# Altium project ArmBand-Control-Board.PrjPcb (part 2 of 3)

## Sheet Controller-Section.SchDoc
size A4; SheetNumber: 5; SheetTotal: 8
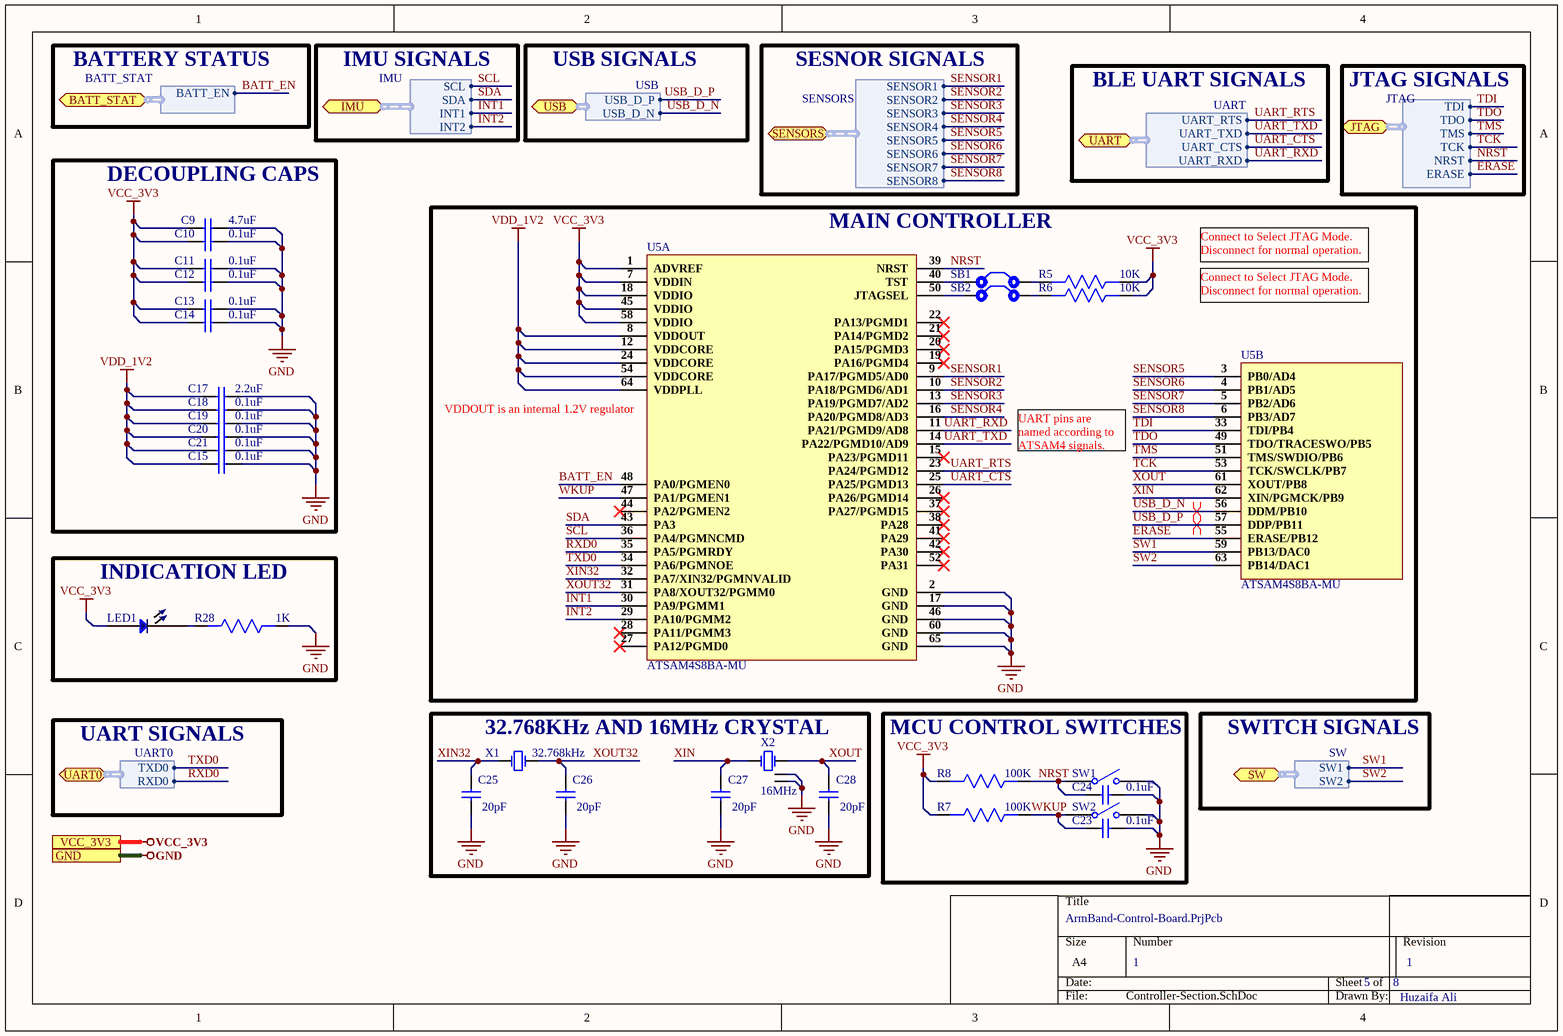
[diagram p4: Controller-Section.SchDoc]

### Parts
C9  4.7uF  [Cap 0402]
C10  0.1uF  [Cap 0402]
C11  0.1uF  [Cap 0402]
C12  0.1uF  [Cap 0402]
C13  0.1uF  [Cap 0402]
C14  0.1uF  [Cap 0402]
C15  0.1uF  [Cap 0402]
C17  2.2uF  [Cap 0402]
C18  0.1uF  [Cap 0402]
C19  0.1uF  [Cap 0402]
C20  0.1uF  [Cap 0402]
C21  0.1uF  [Cap 0402]
C23  0.1uF  [Cap 0402]
C24  0.1uF  [Cap 0402]
C25  20pF  [Cap 0402]
C26  20pF  [Cap 0402]
C27  20pF  [Cap 0402]
C28  20pF  [Cap 0402]
LED1  XZVG68W-2  [LED 0402]  (value not drawn)
R5  10K  [Res0402]
R6  10K  [Res0402]
R7  100K  [Res0402]
R8  100K  [Res0402]
R28  1K  [Res0402]
SB1  Solder Bridge  [Solder Bridge]  (value not drawn)
SB2  Solder Bridge  [Solder Bridge]  (value not drawn)
SW1  TS-1185EC-C-D-B  [TS-1185EC-C-D-B]  (value not drawn)
SW2  TS-1185EC-C-D-B  [TS-1185EC-C-D-B]  (value not drawn)
U5  ATSAM4S8BA-MU  [QFN64]  (parts A,B of 2)
X1  32.768kHz  [X321532768KGD2SI]
X2  16MHz  [X322516MOB4SI]

### Blocks framed on the sheet
DECOUPLING CAPS: C9-C15 C17-C21
MAIN CONTROLLER: R5 R6 SB1 SB2 U5
INDICATION LED: LED1 R28
32.768KHz AND 16MHz CRYSTAL: C25-C28 X1 X2
MCU CONTROL SWITCHES: C23 C24 R7 R8 SW1 SW2

### Ports
BATT_STAT (bidir, harness BATT_STAT), GND, IMU (bidir, harness IMU), JTAG (bidir, harness JTAG), SENSORS (bidir, harness SENSORS), SW (bidir, harness SW), UART0 (bidir, harness UART0), UART (bidir, harness UART), USB (bidir, harness USB), VCC_3V3

### Harnesses
IMU: SCL, SDA, INT1, INT2
JTAG: TDI, TDO, TMS, TCK, NRST, ERASE
UART: UART_RTS, UART_TXD, UART_CTS, UART_RXD
SENSORS: SENSOR1, SENSOR2, SENSOR3, SENSOR4, SENSOR5, SENSOR6, SENSOR7, SENSOR8
BATT_STAT: BATT_EN
SW: SW1, SW2
UART0: TXD0, RXD0
USB: USB_D_P, USB_D_N

### Nets
GND: C9.2 C10.2 C11.2 C12.2 C13.2 C14.2 C15.2 C17.2 C18.2 C19.2 C20.2 C21.2 C23.2 C24.2 C25.1 C26.1 C27.1 C28.1 R28.1 SW1.2 SW2.2 U5.2(GND) U5.17(GND) U5.46(GND) U5.60(GND) U5.65(GND) X2.2(GND) X2.4(GND) ; port GND
VCC_3V3: C9.1 C10.1 C11.1 C12.1 C13.1 C14.1 LED1.1 R5.1 R6.1 R7.2 R8.2 U5.1(ADVREF) U5.7(VDDIN) U5.18(VDDIO) U5.45(VDDIO) U5.58(VDDIO) ; port VCC_3V3
VDD_1V2: C15.1 C17.1 C18.1 C19.1 C20.1 C21.1 U5.8(VDDOUT) U5.12(VDDCORE) U5.24(VDDCORE) U5.54(VDDCORE) U5.64(VDDPLL)
BATT_EN: U5.48(PA0/PGMEN0) ; port BATT_STAT.BATT_EN
ERASE: U5.55(ERASE/PB12) ; port JTAG.ERASE
INT1: U5.30(PA9/PGMM1) ; port IMU.INT1
INT2: U5.29(PA10/PGMM2) ; port IMU.INT2
NRST: C24.1 R8.1 SW1.1 U5.39(NRST) ; port JTAG.NRST
RXD0: U5.35(PA5/PGMRDY) ; port UART0.RXD0
SCL: U5.36(PA4/PGMNCMD) ; port IMU.SCL
SDA: U5.43(PA3) ; port IMU.SDA
SENSOR1: U5.9(PA17/PGMD5/AD0) ; port SENSORS.SENSOR1
SENSOR2: U5.10(PA18/PGMD6/AD1) ; port SENSORS.SENSOR2
SENSOR3: U5.13(PA19/PGMD7/AD2) ; port SENSORS.SENSOR3
SENSOR4: U5.16(PA20/PGMD8/AD3) ; port SENSORS.SENSOR4
SENSOR5: U5.3(PB0/AD4) ; port SENSORS.SENSOR5
SENSOR6: U5.4(PB1/AD5) ; port SENSORS.SENSOR6
SENSOR7: U5.5(PB2/AD6) ; port SENSORS.SENSOR7
SENSOR8: U5.6(PB3/AD7) ; port SENSORS.SENSOR8
SW1: U5.59(PB13/DAC0) ; port SW.SW1
SW2: U5.63(PB14/DAC1) ; port SW.SW2
TCK: U5.53(TCK/SWCLK/PB7) ; port JTAG.TCK
TDI: U5.33(TDI/PB4) ; port JTAG.TDI
TDO: U5.49(TDO/TRACESWO/PB5) ; port JTAG.TDO
TMS: U5.51(TMS/SWDIO/PB6) ; port JTAG.TMS
TXD0: U5.34(PA6/PGMNOE) ; port UART0.TXD0
UART_CTS: U5.25(PA25/PGMD13) ; port UART.UART_CTS
UART_RTS: U5.23(PA24/PGMD12) ; port UART.UART_RTS
UART_RXD: U5.11(PA21/PGMD9/AD8) ; port UART.UART_RXD
UART_TXD: U5.14(PA22/PGMD10/AD9) ; port UART.UART_TXD
USB_D_N: U5.56(DDM/PB10) ; port USB.USB_D_N
USB_D_P: U5.57(DDP/PB11) ; port USB.USB_D_P
WKUP: C23.1 R7.1 SW2.1 U5.47(PA1/PGMEN1)
XIN: C27.2 U5.62(XIN/PGMCK/PB9) X2.1(OSC1)
XIN32: C25.2 U5.32(PA7/XIN32/PGMNVALID) X1.1(OSC1)
XOUT: C28.2 U5.61(XOUT/PB8) X2.3(OSC2)
XOUT32: C26.2 U5.31(PA8/XOUT32/PGMM0) X1.2(OSC2)
NetLED1_2: LED1.2 R28.2
NetR5_2: R5.2 SB1.2
NetR6_2: R6.2 SB2.2
NetSB1_1: SB1.1 U5.40(TST)
NetSB2_1: SB2.1 U5.50(JTAGSEL)

Not connected (* = marked no-connect by the designer): U5 15(PA23/PGMD11)* 19(PA16/PGMD4)* 20(PA15/PGMD3)* 21(PA14/PGMD2)* 22(PA13/PGMD1)* 26(PA26/PGMD14)* 27(PA12/PGMD0)* 28(PA11/PGMM3)* 37(PA27/PGMD15)* 38(PA28)* 41(PA29)* 42(PA30)* 44(PA2/PGMEN2)* 52(PA31)*

### Layout directives
differential pair; net class USB; differential pair class USB_Lines; rule Impedance Constraint [Min = 85.00    Max = 90.00    ]; rule Matched Net Lengths [Tolerance = 50mil]: USB_D_N, USB_D_P

### Notes on the sheet
- BATTERY STATUS
- IMU SIGNALS
- USB SIGNALS
- SESNOR SIGNALS
- BLE UART SIGNALS
- JTAG SIGNALS
- Connect to Select JTAG Mode. Disconnect for normal operation.
- (near U5) VDDOUT is an internal 1.2V regulator
- UART pins are named according to ATSAM4 signals.
- UART SIGNALS
- SWITCH SIGNALS
- 1
- Huzaifa Ali

### Library data of the parts
C9 = EDK105BBJ475MVLF: 16V 4.7uF ±20% 0402 Multilayer Ceramic Capacitors MLCC; Manufacturer: Taiyo Yuden; Manufacturer Part Number: EDK105BBJ475MVLF; Footprint: 0402; Value: 4.7uF
C10-C15 C18-C21 C23 C24 = GRM155R71H104ME14D: CAP CER 0.1UF 50V X7R 0402; Manufacturer: Murata; Tolerance: 20%; Capacitance: 100nF; Supplier 1: Digi-Key; Manufacturer Part Number: GRM155R71H104ME14D; Stock 1: 439844; Pricing 1: 1=0.1, 10=0.038, 100=0.0168, 500=0.01198, 1000=0.00941, 2500=0.00855, 5000=0.00787 (USD); Mount: Surface Mount; Case/Package: 0402; Min Operating Temperature: -55°C; Max Operating Temperature: 125°C; Packaging: Cut Tape; Voltage Rating: 50V; Length: 0.039inch; Width: 0.02inch; Thickness: 0.022inch; ComponentLink1URL: http://search.murata.co.jp/Ceramy/image/img/A01X/G101/ENG/GRM155R71H104ME14-01.pdf?src-supplier=Digi-Key; ComponentLink1Description: http://search.murata.co.jp/Ceramy/image/img/A01X/G101/ENG/GRM155R71H104ME14-01.pdf?src-supplier=Digi-Key; ComponentLink2URL: http://psearch.en.murata.com/capacitor/product/GRM155R71H104ME14%23.pdf?src-supplier=Avnet; ComponentLink2Description: http://psearch.en.murata.com/capacitor/product/GRM155R71H104ME14%23.pdf?src-supplier=Avnet; ComponentLink3URL: http://components.arrow.com/part/dataview/0323_07177683?src-supplier=Arrow+Europe; ComponentLink3Description: http://components.arrow.com/part/dataview/0323_07177683?src-supplier=Arrow+Europe; ComponentLink4URL: http://www.mouser.com/ds/2/281/c02e-2905.pdf?src-supplier=Mouser; ComponentLink4Description: http://www.mouser.com/ds/2/281/c02e-2905.pdf?src-supplier=Mouser; Supplier Part Number 1: 490-10701-1-ND
C17 = GRM155R61E225KE11D: CAP CER 2.2UF 25V X5R 0402; Manufacturer: Murata; Manufacturer Part Number: GRM155R61E225KE11D; Footprint: 0402; Value: 2.2uF
C25-C28 = CC0402JRNPO9BN200: CAP CER 20PF 50V C0G/NPO 0402; Manufacturer: Yageo; Tolerance: 5%; Dielectric: C0G; Supplier 1: Digi-Key; Manufacturer Part Number: CC0402JRNPO9BN200; Stock 1: 453493; Pricing 1: 1=0.1, 10=0.036, 100=0.0162, 500=0.01156, 1000=0.00908, 2500=0.00825, 5000=0.00759 (USD); Mount: Surface Mount; Case/Package: 0402; Number of Pins: 2; Weight: 2.3E-05oz; Case Code (Metric): 1005; Case Code (Imperial): 0402; Min Operating Temperature: -55°C; Max Operating Temperature: 125°C; Capacitance: 20pF; Voltage Rating: 50V; Packaging: Tape and Reel; Package Quantity: 1; Voltage Rating (DC): 50V; Termination: SMD/SMT; Composition: Ceramic; Length: 1mm; Width: 0.02inch; Thickness: 0.022inch; Depth: 0.5mm; REACH SVHC: No SVHC; Lead Free: Lead Free; ComponentLink1URL: http://www.yageo.com/documents/recent/UPY-GP_NP0_16V-to-50V_16.pdf?src-supplier=Digi-Key; ComponentLink1Description: http://www.yageo.com/documents/recent/UPY-GP_NP0_16V-to-50V_16.pdf?src-supplier=Digi-Key; ComponentLink2URL: http://www.yageo.com/documents/recent/UPY-GP_NP0_16V-to-50V_16.pdf?src-supplier=Mouser; ComponentLink2Description: http://www.yageo.com/documents/recent/UPY-GP_NP0_16V-to-50V_16.pdf?src-supplier=Mouser; Supplier Part Number 1: 311-1417-1-ND
LED1 = XZVG68W-2: LED GREEN CLEAR CHIP SMD; Manufacturer: SunLED; Lens Color: Colorless; Luminous Intensity: 49mcd; Test Current: 20mA; Viewing Angle: 120°; Dominant Wavelength: 570nm; Forward Voltage: 2.1V; Supplier 1: Digi-Key; Manufacturer Part Number: XZVG68W-2; Stock 1: 4185; Pricing 1: 1=0.5, 10=0.36, 100=0.16, 500=0.112, 1000=0.092 (USD); Mount: Surface Mount; Case/Package: 0402; Color: Green; Case Code (Metric): 1005; Case Code (Imperial): 0402; Packaging: Tape and Reel; Lens Transparency: Clear; Length: 1mm; Height: 0.6mm; Width: 0.5mm; ComponentLink1URL: http://www.sunledusa.com/products/spec/XZVG68W-2.pdf?src-supplier=Digi-Key; ComponentLink1Description: http://www.sunledusa.com/products/spec/XZVG68W-2.pdf?src-supplier=Digi-Key; ComponentLink2URL: https://www.sunledusa.com/products/spec/XZVG68W-2.pdf?src-supplier=Digi-Key; ComponentLink2Description: https://www.sunledusa.com/products/spec/XZVG68W-2.pdf?src-supplier=Digi-Key; Supplier Part Number 1: 1497-1219-6-ND
R5 R6 = RC0402FR-0710KL: RES SMD 10K OHM 1% 1/16W 0402; Manufacturer: Yageo; Resistance: 10kR; Temperature Coefficient: 100ppm/°C; Voltage Rating (DC): 50V; Power Rating: 62.5mW; Supplier 1: Digi-Key; Manufacturer Part Number: RC0402FR-0710KL; Stock 1: 60122563; Pricing 1: 1=0.1, 10=0.016, 100=0.0064, 1000=0.00289, 2500=0.00251, 5000=0.00207 (USD); Case/Package: 0402; Number of Pins: 2; Case Code (Imperial): 0402; Case Code (Metric): 1005; Min Operating Temperature: -55°C; Max Operating Temperature: 155°C; Composition: Thick Film; Tolerance: 1%; Packaging: Tape and Reel; Voltage Rating: 50V; Termination: SMD/SMT; Military Standard: Not; Working Voltage: 50V; Number of Terminations: 2; Length: 1mm; Height: 0.32mm; Width: 0.5mm; Depth: 0.5mm; Lead Pitch: 0.2mm; REACH SVHC: No SVHC; Lead Free: Lead Free; ComponentLink1URL: http://www.farnell.com/datasheets/2167052.pdf?src-supplier=Element14; ComponentLink1Description: http://www.farnell.com/datasheets/2167052.pdf?src-supplier=Element14; ComponentLink2URL: http://www.farnell.com/datasheets/1686128.pdf?src-supplier=Element14; ComponentLink2Description: http://www.farnell.com/datasheets/1686128.pdf?src-supplier=Element14; ComponentLink3URL: http://www.farnell.com/datasheets/1784430.pdf?src-supplier=Element14; ComponentLink3Description: http://www.farnell.com/datasheets/1784430.pdf?src-supplier=Element14; ComponentLink4URL: http://www.yageo.com/documents/recent/PYu-RC_Group_51_RoHS_L_9.pdf?src-supplier=Mouser; ComponentLink4Description: http://www.yageo.com/documents/recent/PYu-RC_Group_51_RoHS_L_9.pdf?src-supplier=Mouser; Supplier Part Number 1: 311-10.0KLRDKR-ND
R7 R8 = ERJPA2F1003X: RES SMD 100K OHM 1% 1/5W 0402; Manufacturer: Panasonic; Manufacturer Part Number: ERJ-PA2F1003X; Resistance: 100kR; Power Rating: 200mW; Voltage Rating: 50V; Temperature Coefficient: 100ppm/°C; Supplier 1: Digi-Key; Stock 1: 8829; Pricing 1: 1=0.21, 10=0.175, 100=0.0686, 1000=0.02871, 2500=0.02632, 5000=0.02393 (USD); Case/Package: 0402; Case Code (Metric): 1005; Case Code (Imperial): 0402; Min Operating Temperature: -55°C; Max Operating Temperature: 155°C; Packaging: Cut Tape; Composition: Thick Film; Number of Terminations: 2; Tolerance: 1%; Max Power Dissipation: 200mW; Voltage Rating (DC): 50V; Features: Automotive AEC-Q200; Length: 0.039inch; Height: 0.016inch; Width: 0.02inch; REACH SVHC: Unknown; ComponentLink1URL: http://www.farnell.com/datasheets/2051174.pdf?src-supplier=Element14; ComponentLink1Description: http://www.farnell.com/datasheets/2051174.pdf?src-supplier=Element14; ComponentLink2URL: https://industrial.panasonic.com/ww/system/files/data/download/catalog/id_fixed-resistors_e_1.pdf?src-supplier=Digi-Key; ComponentLink2Description: https://industrial.panasonic.com/ww/system/files/data/download/catalog/id_fixed-resistors_e_1.pdf?src-supplier=Digi-Key; Supplier Part Number 1: P17236CT-ND
R28 = RC0402JR-071KL: RES 1K OHM 5% 1/16W 0402; Manufacturer: Yageo; Resistance: 1kR; Power Rating: 62.5mW; Voltage Rating: 50V; Temperature Coefficient: 100ppm/°C; Max Power Dissipation: 63mW; Supplier 1: Digi-Key; Manufacturer Part Number: RC0402JR-071KL; RoHS: Yes; Category: Chip SMD Resistors; Stock 1: 452315; Pricing 1: 1=0.10000, 10=0.01300, 100=0.00540, 1000=0.00244, 2500=0.00212, 5000=0.00175 (USD); Case/Package: 0402; Case Code (Imperial): 0402; Case Code (Metric): 1005; Size Code: 0402; Min Operating Temperature: -55°C; Max Operating Temperature: 155°C; Tolerance: 5%; Packaging: Tape and Reel; Package Quantity: 1; Termination: SMD/SMT; Resistor Type: Thick Film; Number of Terminations: 2; Features: Moisture Resistant; Series: RC; Resistance Tolerance: 5%; Construction: Rectangular; Length: 0.039inch; Width: 0.02inch; Height: 0.016inch; Depth: 0.5mm; REACH SVHC: No SVHC; Military Standard: Not; Lead Free: Lead Free; RoHS Compliant: Yes; ComponentLink1URL: https://datasheet.ciiva.com/7983/1018594-7983558.pdf?src-supplier=Element14; ComponentLink1Description: https://datasheet.ciiva.com/7983/1018594-7983558.pdf?src-supplier=Element14; ComponentLink2URL: https://datasheet.ciiva.com/2452/pyu-r-int-thick-7-2452756.pdf?src-supplier=Digi-Key; ComponentLink2Description: https://datasheet.ciiva.com/2452/pyu-r-int-thick-7-2452756.pdf?src-supplier=Digi-Key; ComponentLink3URL: https://datasheet.ciiva.com/2452/pyu-r-int-thick-7-2452757.pdf?src-supplier=Digi-Key; ComponentLink3Description: https://datasheet.ciiva.com/2452/pyu-r-int-thick-7-2452757.pdf?src-supplier=Digi-Key; ComponentLink4URL: https://datasheet.ciiva.com/2452/pyu-r-int-thick-7-2452755.pdf?src-supplier=Digi-Key; ComponentLink4Description: https://datasheet.ciiva.com/2452/pyu-r-int-thick-7-2452755.pdf?src-supplier=Digi-Key; ComponentLink5URL: https://datasheet.ciiva.com/7850/1018594-7850170.pdf?src-supplier=Element14; ComponentLink5Description: https://datasheet.ciiva.com/7850/1018594-7850170.pdf?src-supplier=Element14; ComponentLink6URL: https://datasheet.ciiva.com/7850/1018594-7850171.pdf?src-supplier=Element14; ComponentLink6Description: https://datasheet.ciiva.com/7850/1018594-7850171.pdf?src-supplier=Element14; ComponentLink7URL: https://datasheet.ciiva.com/17081/pyu-rc0402-51-rohs-l-6-r-17081438.pdf?src-supplier=Future+Electronics; ComponentLink7Description: https://datasheet.ciiva.com/17081/pyu-rc0402-51-rohs-l-6-r-17081438.pdf?src-supplier=Future+Electronics; Supplier Part Number 1: 311-1.0KJRCT-ND
SB1 SB2 = Solder Bridge: Solder Bridge ON
SW1 SW2 = TS-1185EC-C-D-B: 3mm 2mm Round Button 50mA Top3.65mm SPST 12V SMD Tactile Switches; Manufacturer: XKB; Manufacturer Part Number: TS-1185EC-C-D-B; Footprint: Custom; ComponentLink1Description: LCSC; ComponentLink1URL: https://lcsc.com/product-detail/Tactile-Switches_XKB-Connectivity-TS-1185EC-C-D-B_C318893.html
U5 = ATSAM4S8BA-MU: IC MCU 32BIT 512KB FLASH 64QFN; Manufacturer: Microchip; Interface: I2C,SPI,USB,IrDA,UART,USART; Peripherals: Brown-out Detect/Reset,POR,PWM,WDT,DMA; Core Architecture: ARM; Frequency: 120MHz; Oscillator Type: Internal; Number of I/Os: 47; Supplier 1: Digi-Key; Manufacturer Part Number: ATSAM4S8BA-MU; RoHS: Yes; Category: Microcontrollers; Pricing 1: 1=6.23000, 25=5.66960, 100=5.13000 (USD); Case/Package: QFN; Min Operating Temperature: -40°C; Max Operating Temperature: 85°C; Memory Type: FLASH; Packaging: Tray; Memory Size: 512KB; RoHS Compliant: Yes; ComponentLink1URL: http://www.microchip.com/mymicrochip/filehandler.aspx?ddocname=en590343&src-supplier=Digi-Key; ComponentLink1Description: http://www.microchip.com/mymicrochip/filehandler.aspx?ddocname=en590343&src-supplier=Digi-Key; Supplier Part Number 1: ATSAM4S8BA-MU-ND
X1 = X321532768KGD2SI: 32.768kHz SMD Crystal Resonator 12.5pF ±20ppm -40℃~+85℃ SMD3215-2P Crystals ROHS; Manufacturer: Yangxing Tech; Manufacturer Part Number: X321532768KGD2SI; Footprint: Custom; ComponentLink1Description: LCSC; ComponentLink1URL: https://www.lcsc.com/product-detail/Crystals_Yangxing-Tech-X321532768KGD2SI_C620155.html
X2 = X322516MOB4SI: 16MHz SMD Crystal Resonator 12pF ±10ppm ±30ppm -40℃~+85℃ SMD3225-4P Crystals ROHS; Manufacturer: Yangxing Tech; Manufacturer Part Number: X322516MOB4SI; Footprint: Custom; ComponentLink1Description: LCSC; ComponentLink1URL: https://www.lcsc.com/product-detail/Crystals_Yangxing-Tech-X322516MOB4SI_C12668.html

## Sheet IMU-Section.SchDoc
size A4; SheetNumber: 7; SheetTotal: 8
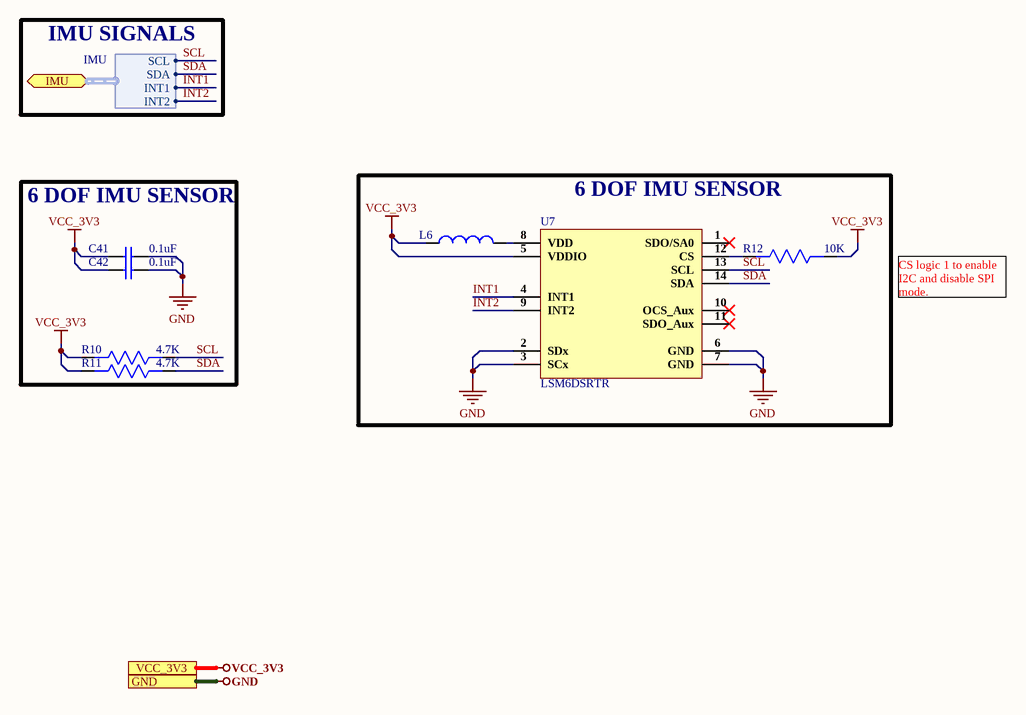
[diagram p5: IMU-Section.SchDoc]

### Parts
C41  0.1uF  [Cap 0402]
C42  0.1uF  [Cap 0402]
L6  BLM18PG300SN1D  [IND 0603]  (value not drawn)
R10  4.7K  [Res0402]
R11  4.7K  [Res0402]
R12  10K  [Res0402]
U7  LSM6DSRTR  [14-LGA (2.5x3)]

### Blocks framed on the sheet
6 DOF IMU SENSOR: C41 C42 R10 R11
6 DOF IMU SENSOR: L6 R12 U7

### Ports
GND, IMU (bidir, harness IMU), VCC_3V3

### Harnesses
IMU: SCL, SDA, INT1, INT2

### Nets
GND: C41.2 C42.2 U7.2(SDx) U7.3(SCx) U7.6(GND) U7.7(GND) ; port GND
VCC_3V3: C41.1 C42.1 L6.1 R10.2 R11.2 R12.1 U7.5(VDDIO) ; port VCC_3V3
INT1: U7.4(INT1) ; port IMU.INT1
INT2: U7.9(INT2) ; port IMU.INT2
SCL: R10.1 U7.13(SCL) ; port IMU.SCL
SDA: R11.1 U7.14(SDA) ; port IMU.SDA
NetL6_2: L6.2 U7.8(VDD)
NetR12_2: R12.2 U7.12(CS)

Not connected (* = marked no-connect by the designer): U7 1(SDO/SA0)* 10(OCS_Aux)* 11(SDO_Aux)*

### Notes on the sheet
- IMU SIGNALS
- CS logic 1 to enable I2C and disable SPI mode.
- 1
- Huzaifa Ali

### Library data of the parts
C41 C42 = GRM155R71H104ME14D: as C10 on sheet Controller-Section; Supplier 1: Digi-Key; Manufacturer Part Number: GRM155R71H104ME14D; Stock 1: 439844; Pricing 1: 1=0.1, 10=0.038, 100=0.0168, 500=0.01198, 1000=0.00941, 2500=0.00855, 5000=0.00787 (USD); Mount: Surface Mount; Case/Package: 0402; Min Operating Temperature: -55°C; Max Operating Temperature: 125°C; Packaging: Cut Tape; Voltage Rating: 50V; Length: 0.039inch; Width: 0.02inch; Thickness: 0.022inch; ComponentLink1URL: http://search.murata.co.jp/Ceramy/image/img/A01X/G101/ENG/GRM155R71H104ME14-01.pdf?src-supplier=Digi-Key; ComponentLink1Description: http://search.murata.co.jp/Ceramy/image/img/A01X/G101/ENG/GRM155R71H104ME14-01.pdf?src-supplier=Digi-Key; ComponentLink2URL: http://psearch.en.murata.com/capacitor/product/GRM155R71H104ME14%23.pdf?src-supplier=Avnet; ComponentLink2Description: http://psearch.en.murata.com/capacitor/product/GRM155R71H104ME14%23.pdf?src-supplier=Avnet; ComponentLink3URL: http://components.arrow.com/part/dataview/0323_07177683?src-supplier=Arrow+Europe; ComponentLink3Description: http://components.arrow.com/part/dataview/0323_07177683?src-supplier=Arrow+Europe; ComponentLink4URL: http://www.mouser.com/ds/2/281/c02e-2905.pdf?src-supplier=Mouser; ComponentLink4Description: http://www.mouser.com/ds/2/281/c02e-2905.pdf?src-supplier=Mouser; Supplier Part Number 1: 490-10701-1-ND
L6 = BLM18PG300SN1D: FERRITE BEAD 30 OHM 0603 1LN / Ferrite Beads Multi-Layer 30Ohm 100MHz 1A 0.05Ohm DCR 0603 T/R; Manufacturer: Murata; Material: Steel,Ferrite; Impedance: 30R; Tolerance: 25%; DC Resistance (DCR): 50mR; Number of Lines: 1; Shielding: Unshielded; Supplier 1: RSComponents; Manufacturer Part Number: BLM18PG300SN1D; RoHS: Yes; Category: Inductors; Stock 1: 3100; Pricing 1: 25=0.07200, 1000=0.06200, 2000=0.05400, 5000=0.04700, 10000=0.04300 (GBP); Case/Package: 0603; Number of Pins: 2; Core Material: Ferrite; Case Code (Metric): 1608; Case Code (Imperial): 0603; Min Operating Temperature: -55°C; Max Operating Temperature: 125°C; Package Quantity: 4000; Max Current Rating: 1A; Packaging: Tape and Reel; Current Rating: 1A; Max DC Current: 1A; Termination: SMD/SMT; Test Frequency: 100MHz; DC Current: 1A; Frequency: 100MHz; Number of Circuits: 1; Series: BLM18P; DC Resistance-Max: 50mR; Length: 1.6mm; Width: 0.8mm; Height: 0.8mm; Depth: 0.8mm; Radiation Hardening: No; REACH SVHC: No SVHC; Lead Free: Lead Free; RoHS Compliant: Yes; ComponentLink1URL: https://datasheet.ciiva.com/19460/1845048-19460200.pdf?src-supplier=Jameco; ComponentLink1Description: https://datasheet.ciiva.com/19460/1845048-19460200.pdf?src-supplier=Jameco; ComponentLink2URL: https://datasheet.ciiva.com/11800/0900766b81275ca5-11800868.pdf?src-supplier=RSComponents; ComponentLink2Description: https://datasheet.ciiva.com/11800/0900766b81275ca5-11800868.pdf?src-supplier=RSComponents; ComponentLink3URL: https://datasheet.ciiva.com/8021/5148-8021484.pdf?src-supplier=Element14; ComponentLink3Description: https://datasheet.ciiva.com/8021/5148-8021484.pdf?src-supplier=Element14; ComponentLink4URL: https://datasheet.ciiva.com/8021/5148-8021486.pdf?src-supplier=Element14; ComponentLink4Description: https://datasheet.ciiva.com/8021/5148-8021486.pdf?src-supplier=Element14; ComponentLink5URL: https://datasheet.ciiva.com/1012/l0110s0100blm18p-1012120.pdf?src-supplier=Digi-Key; ComponentLink5Description: https://datasheet.ciiva.com/1012/l0110s0100blm18p-1012120.pdf?src-supplier=Digi-Key; ComponentLink6URL: https://datasheet.ciiva.com/1012/l0110s0100blm18p-1012119.pdf?src-supplier=Digi-Key; ComponentLink6Description: https://datasheet.ciiva.com/1012/l0110s0100blm18p-1012119.pdf?src-supplier=Digi-Key; ComponentLink7URL: https://datasheet.ciiva.com/1012/l0110s0100blm18p-1012121.pdf?src-supplier=Digi-Key; ComponentLink7Description: https://datasheet.ciiva.com/1012/l0110s0100blm18p-1012121.pdf?src-supplier=Digi-Key; ComponentLink8URL: https://datasheet.ciiva.com/3081/l0110s0100blm18p-3081636.pdf?src-supplier=Avnet; ComponentLink8Description: https://datasheet.ciiva.com/3081/l0110s0100blm18p-3081636.pdf?src-supplier=Avnet; Supplier Part Number 1: 7241403
R10 R11 = ERJ2GEJ472X: RES SMD 4.7K OHM 5% 1/10W 0402; Manufacturer: Panasonic; Manufacturer Part Number: ERJ-2GEJ472X; Resistance: 4.7kR; Temperature Coefficient: 200ppm/°C; Power Rating: 100mW; Voltage Rating: 50V; Supplier 1: Arrow Electronics; RoHS: Yes; Category: Chip SMD Resistors; Stock 1: 1650000; Pricing 1: 10000=0.00340 (USD); Mount: Surface Mount; Case/Package: 0402; Contact Plating: Tin; Case Code (Imperial): 0402; Case Code (Metric): 1005; Size Code: 0402; Min Operating Temperature: -55°C; Max Operating Temperature: 155°C; Tolerance: 5%; Resistor Type: Thick Film; Packaging: Cut Tape; Package Quantity: 1; Termination: SMD/SMT; Number of Terminations: 2; Max Power Dissipation: 100mW; Voltage Rating (DC): 50V; Features: Automotive AEC-Q200; Series: ERJ; Technology: THICK FILM; Resistance Tolerance: 5%; Construction: Rectangular; Length: 1mm; Width: 0.5mm; Height: 0.35mm; Depth: 0.5mm; Radiation Hardening: No; REACH SVHC: No SVHC; Military Standard: Not; Lead Free: Lead Free; RoHS Compliant: Yes; ComponentLink1URL: https://datasheet.ciiva.com/11821/0900766b80f806dd-11821328.pdf?src-supplier=RSComponents; ComponentLink1Description: https://datasheet.ciiva.com/11821/0900766b80f806dd-11821328.pdf?src-supplier=RSComponents; ComponentLink2URL: https://datasheet.ciiva.com/46377/1678796-46377565.pdf?src-supplier=Element14; ComponentLink2Description: https://datasheet.ciiva.com/46377/1678796-46377565.pdf?src-supplier=Element14; ComponentLink3URL: https://datasheet.ciiva.com/28514/1678796-28514168.pdf?src-supplier=Element14; ComponentLink3Description: https://datasheet.ciiva.com/28514/1678796-28514168.pdf?src-supplier=Element14; ComponentLink4URL: https://datasheet.ciiva.com/16758/70260739-16758341.pdf?src-supplier=Allied+Electronics; ComponentLink4Description: https://datasheet.ciiva.com/16758/70260739-16758341.pdf?src-supplier=Allied+Electronics; ComponentLink5URL: https://datasheet.ciiva.com/16770/70260739-16770309.pdf?src-supplier=Allied+Electronics; ComponentLink5Description: https://datasheet.ciiva.com/16770/70260739-16770309.pdf?src-supplier=Allied+Electronics; Supplier Part Number 1: ERJ-2GEJ472X
R12 = RC0402FR-0710KL: as R5 on sheet Controller-Section; Supplier 1: Digi-Key; Manufacturer Part Number: RC0402FR-0710KL; Stock 1: 60122563; Pricing 1: 1=0.1, 10=0.016, 100=0.0064, 1000=0.00289, 2500=0.00251, 5000=0.00207 (USD); Case/Package: 0402; Number of Pins: 2; Case Code (Imperial): 0402; Case Code (Metric): 1005; Min Operating Temperature: -55°C; Max Operating Temperature: 155°C; Composition: Thick Film; Tolerance: 1%; Packaging: Tape and Reel; Voltage Rating: 50V; Termination: SMD/SMT; Military Standard: Not; Working Voltage: 50V; Number of Terminations: 2; Length: 1mm; Height: 0.32mm; Width: 0.5mm; Depth: 0.5mm; Lead Pitch: 0.2mm; REACH SVHC: No SVHC; Lead Free: Lead Free; ComponentLink1URL: http://www.farnell.com/datasheets/2167052.pdf?src-supplier=Element14; ComponentLink1Description: http://www.farnell.com/datasheets/2167052.pdf?src-supplier=Element14; ComponentLink2URL: http://www.farnell.com/datasheets/1686128.pdf?src-supplier=Element14; ComponentLink2Description: http://www.farnell.com/datasheets/1686128.pdf?src-supplier=Element14; ComponentLink3URL: http://www.farnell.com/datasheets/1784430.pdf?src-supplier=Element14; ComponentLink3Description: http://www.farnell.com/datasheets/1784430.pdf?src-supplier=Element14; ComponentLink4URL: http://www.yageo.com/documents/recent/PYu-RC_Group_51_RoHS_L_9.pdf?src-supplier=Mouser; ComponentLink4Description: http://www.yageo.com/documents/recent/PYu-RC_Group_51_RoHS_L_9.pdf?src-supplier=Mouser; Supplier Part Number 1: 311-10.0KLRDKR-ND
U7 = LSM6DSRTR: iNEMO Inertial Module: 3D Accelerometer and 3D Gyroscope, 1.71V to 3.6V, -40°C to 85°C, VFLGA-14L, RoHS; Manufacturer: STMicroelectronics; Supplier 1: Newark; Manufacturer Part Number: LSM6DSRTR; RoHS: Yes; Category: Inertial Measurement Units (IMUs); RoHS Compliant: Yes; ComponentLink1URL: https://www.st.com/resource/en/datasheet/lsm6dsr.pdf?src-supplier=Digi-Key; ComponentLink1Description: https://www.st.com/resource/en/datasheet/lsm6dsr.pdf?src-supplier=Digi-Key; Supplier Part Number 1: 03AH2347

## Sheet BLE-Section.SchDoc
size A4; SheetNumber: 6; SheetTotal: 8
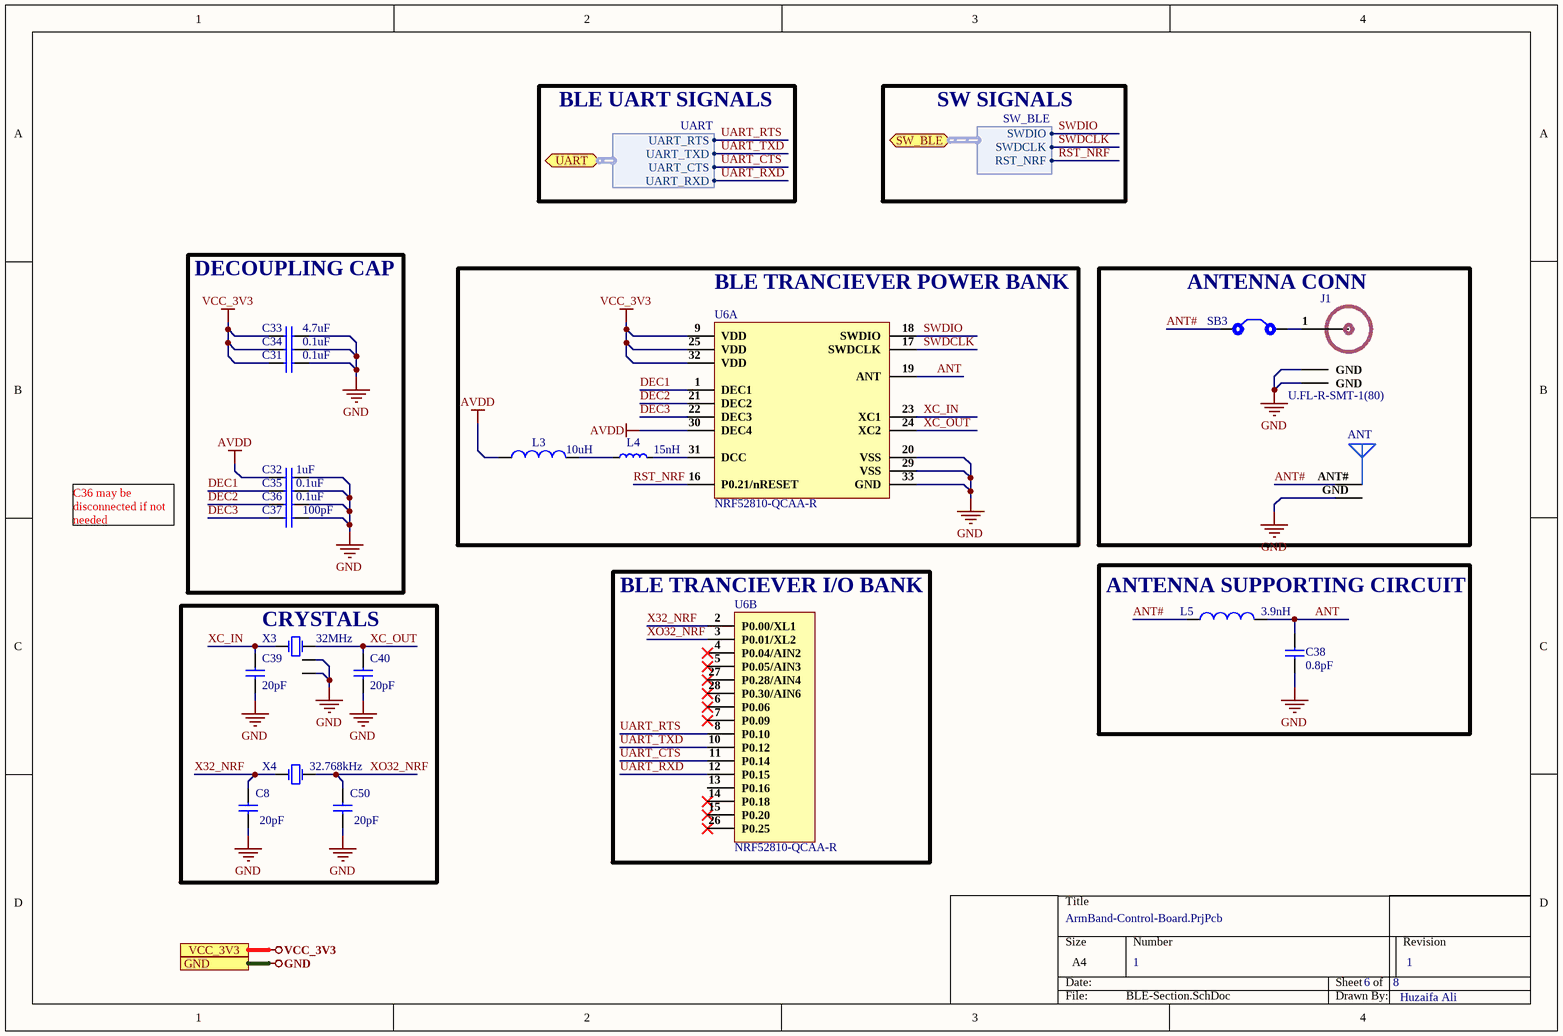
[diagram p6: BLE-Section.SchDoc]

### Parts
ANT  Antenna  [ANT#]  (value not drawn)  (net tie)
C8  20pF  [Cap 0402]
C31  0.1uF  [Cap 0402]
C32  1uF  [Cap 0402]
C33  4.7uF  [Cap 0402]
C34  0.1uF  [Cap 0402]
C35  0.1uF  [Cap 0402]
C36  0.1uF  [Cap 0402]
C37  100pF  [Cap 0402]
C38  0.8pF  [Cap 0402]
C39  20pF  [Cap 0402]
C40  20pF  [Cap 0402]
C50  20pF  [Cap 0402]
J1  U.FL-R-SMT-1(80)  [U.FL-R-SMT-1(80)]
L3  10uH  [Ind0805]
L4  15nH  [IND-0402]
L5  3.9nH  [IND 0603]
SB3  Solder Bridge  [Solder Bridge]  (value not drawn)
U6  NRF52810-QCAA-R  [32 QFN]  (parts A,B of 2)
X3  32MHz  [XC32M4-32.000-F12NLDT]
X4  32.768kHz  [X321532768KGD2SI]

### Blocks framed on the sheet
DECOUPLING CAP: C31-C37
BLE TRANCIEVER POWER BANK: L3 L4 U6
ANTENNA CONN: ANT J1 SB3
ANTENNA SUPPORTING CIRCUIT: C38 L5
CRYSTALS: C8 C39 C40 C50 X3 X4
BLE TRANCIEVER I/O BANK: U6

### Ports
GND, SW_BLE (bidir, harness SW_BLE), UART (bidir, harness UART), VCC_3V3

### Harnesses
UART: UART_RTS, UART_TXD, UART_CTS, UART_RXD
SW_BLE: SWDIO, SWDCLK, RST_NRF

### Nets
AVDD: C32.1 L3.2 U6.30(DEC4)
GND: ANT.GND C8.1 C31.2 C32.2 C33.2 C34.2 C35.1 C36.1 C37.2 C38.1 C39.1 C40.1 C50.1 J1.2(GND) J1.3(GND) U6.20(VSS) U6.29(VSS) U6.33(GND) X3.2(GND) X3.4(GND) ; port GND
VCC_3V3: C31.1 C33.1 C34.1 U6.9(VDD) U6.25(VDD) U6.32(VDD) ; port VCC_3V3
ANT: C38.2 L5.2 U6.19(ANT)
ANT#: ANT.ANT# L5.1 SB3.1
DEC1: C35.2 U6.1(DEC1)
DEC2: C36.2 U6.21(DEC2)
DEC3: C37.1 U6.22(DEC3)
RST_NRF: U6.16(P0.21/nRESET) ; port SW_BLE.RST_NRF
SWDCLK: U6.17(SWDCLK) ; port SW_BLE.SWDCLK
SWDIO: U6.18(SWDIO) ; port SW_BLE.SWDIO
UART_CTS: U6.11(P0.14) ; port UART.UART_CTS
UART_RTS: U6.8(P0.10) ; port UART.UART_RTS
UART_RXD: U6.12(P0.15) ; port UART.UART_RXD
UART_TXD: U6.10(P0.12) ; port UART.UART_TXD
X32_NRF: C8.2 U6.2(P0.00/XL1) X4.1(OSC1)
XC_IN: C39.2 U6.23(XC1) X3.1(OSC1)
XC_OUT: C40.2 U6.24(XC2) X3.3(OSC2)
XO32_NRF: C50.2 U6.3(P0.01/XL2) X4.2(OSC2)
NetJ1_1: J1.1(RF_IN) SB3.2
NetL3_1: L3.1 L4.1
NetL4_2: L4.2 U6.31(DCC)

Not connected (* = marked no-connect by the designer): U6 4(P0.04/AIN2)* 5(P0.05/AIN3)* 6(P0.06)* 7(P0.09)* 13(P0.16) 14(P0.18)* 15(P0.20)* 26(P0.25)* 27(P0.28/AIN4)* 28(P0.30/AIN6)*

### Notes on the sheet
- BLE UART SIGNALS
- SW SIGNALS
- C36 may be disconnected if not needed
- 1
- Huzaifa Ali

### Library data of the parts
C8 C39 C40 C50 = CC0402JRNPO9BN200: as C25 on sheet Controller-Section; Supplier 1: Digi-Key; Manufacturer Part Number: CC0402JRNPO9BN200; Stock 1: 453493; Pricing 1: 1=0.1, 10=0.036, 100=0.0162, 500=0.01156, 1000=0.00908, 2500=0.00825, 5000=0.00759 (USD); Mount: Surface Mount; Case/Package: 0402; Number of Pins: 2; Weight: 2.3E-05oz; Case Code (Metric): 1005; Case Code (Imperial): 0402; Min Operating Temperature: -55°C; Max Operating Temperature: 125°C; Capacitance: 20pF; Voltage Rating: 50V; Packaging: Tape and Reel; Package Quantity: 1; Voltage Rating (DC): 50V; Termination: SMD/SMT; Composition: Ceramic; Length: 1mm; Width: 0.02inch; Thickness: 0.022inch; Depth: 0.5mm; REACH SVHC: No SVHC; Lead Free: Lead Free; ComponentLink1URL: http://www.yageo.com/documents/recent/UPY-GP_NP0_16V-to-50V_16.pdf?src-supplier=Digi-Key; ComponentLink1Description: http://www.yageo.com/documents/recent/UPY-GP_NP0_16V-to-50V_16.pdf?src-supplier=Digi-Key; ComponentLink2URL: http://www.yageo.com/documents/recent/UPY-GP_NP0_16V-to-50V_16.pdf?src-supplier=Mouser; ComponentLink2Description: http://www.yageo.com/documents/recent/UPY-GP_NP0_16V-to-50V_16.pdf?src-supplier=Mouser; Supplier Part Number 1: 311-1417-1-ND
C31 C34-C36 = GRM155R71H104ME14D: as C10 on sheet Controller-Section; Supplier 1: Digi-Key; Manufacturer Part Number: GRM155R71H104ME14D; Stock 1: 439844; Pricing 1: 1=0.1, 10=0.038, 100=0.0168, 500=0.01198, 1000=0.00941, 2500=0.00855, 5000=0.00787 (USD); Mount: Surface Mount; Case/Package: 0402; Min Operating Temperature: -55°C; Max Operating Temperature: 125°C; Packaging: Cut Tape; Voltage Rating: 50V; Length: 0.039inch; Width: 0.02inch; Thickness: 0.022inch; ComponentLink1URL: http://search.murata.co.jp/Ceramy/image/img/A01X/G101/ENG/GRM155R71H104ME14-01.pdf?src-supplier=Digi-Key; ComponentLink1Description: http://search.murata.co.jp/Ceramy/image/img/A01X/G101/ENG/GRM155R71H104ME14-01.pdf?src-supplier=Digi-Key; ComponentLink2URL: http://psearch.en.murata.com/capacitor/product/GRM155R71H104ME14%23.pdf?src-supplier=Avnet; ComponentLink2Description: http://psearch.en.murata.com/capacitor/product/GRM155R71H104ME14%23.pdf?src-supplier=Avnet; ComponentLink3URL: http://components.arrow.com/part/dataview/0323_07177683?src-supplier=Arrow+Europe; ComponentLink3Description: http://components.arrow.com/part/dataview/0323_07177683?src-supplier=Arrow+Europe; ComponentLink4URL: http://www.mouser.com/ds/2/281/c02e-2905.pdf?src-supplier=Mouser; ComponentLink4Description: http://www.mouser.com/ds/2/281/c02e-2905.pdf?src-supplier=Mouser; Supplier Part Number 1: 490-10701-1-ND
C32 = CC0402KRX5R7BB105: CAP CER 1UF 16V X5R 0402; Manufacturer: Yageo; Tolerance: 10%; Supplier 1: Digi-Key; Manufacturer Part Number: CC0402KRX5R7BB105; Stock 1: 1405667; Pricing 1: 1=0.36, 10=0.252, 100=0.1512, 500=0.1134, 1000=0.09576, 2500=0.09072, 5000=0.08568 (USD); Mount: Surface Mount; Case/Package: 0402; Weight: 2.3E-05oz; Case Code (Imperial): 0402; Case Code (Metric): 1005; Min Operating Temperature: -55°C; Max Operating Temperature: 85°C; Capacitance: 1uF; Dielectric: X5R; Packaging: Tape and Reel; Voltage Rating (DC): 16V; Voltage Rating: 16V; Termination: SMD/SMT; Composition: Ceramic; Length: 1mm; Height: 0.5mm; Width: 0.02inch; Thickness: 0.022inch; Depth: 0.5mm; Radiation Hardening: No; Lead Free: Lead Free; Halogen Free: Halogen Free; ComponentLink1URL: http://www.yageo.com/documents/recent/UPY-GPHC_X5R_4V-to-50V_12.pdf?src-supplier=Avnet+Europe; ComponentLink1Description: http://www.yageo.com/documents/recent/UPY-GPHC_X5R_4V-to-50V_12.pdf?src-supplier=Avnet+Europe; Supplier Part Number 1: 311-1691-6-ND
C33 = EDK105BBJ475MVLF: as C9 on sheet Controller-Section; Manufacturer Part Number: EDK105BBJ475MVLF; Footprint: 0402; Value: 4.7uF
C37 = GCM1555C1H101JA16D: 0402 100 pF 50 V ±5 % Tolerance C0G SMT Multilayer Ceramic Capacitor; Manufacturer: Murata; Tolerance: 5%; Voltage Rating: 50V; Supplier 1: Arrow Electronics; Manufacturer Part Number: GCM1555C1H101JA16D; RoHS: Yes; Category: Ceramic Capacitors; Stock 1: 4560000; Pricing 1: 10000=0.00290 (USD); Mount: Surface Mount; Case/Package: 0402; Case Code (Metric): 1005; Case Code (Imperial): 0402; Weight: 0.000212oz; Min Operating Temperature: -55°C; Max Operating Temperature: 125°C; Capacitance: 100pF; Packaging: Tape and Reel; Dielectric: C0G; Voltage: 50V; Termination: SMD/SMT; Voltage Rating (DC): 50V; Package Quantity: 10000; Length: 1mm; Width: 0.02inch; Height: 0.5mm; Thickness: 0.022inch; Depth: 0.5mm; Ratings: AEC-Q200; Radiation Hardening: No; REACH SVHC: No SVHC; Lead Free: Lead Free; RoHS Compliant: Yes; ComponentLink1URL: https://datasheet.ciiva.com/26889/getdatasheetpartid-748988-26889122.pdf?src-supplier=Verical; ComponentLink1Description: https://datasheet.ciiva.com/26889/getdatasheetpartid-748988-26889122.pdf?src-supplier=Verical; Supplier Part Number 1: GCM1555C1H101JA16D
C38 = GJM1555C1HR80WB01D: CAP CER 0.8PF 50V C0G/NP0 0402; Manufacturer: Murata; Dielectric: C0G; Supplier 1: Arrow Electronics; Manufacturer Part Number: GJM1555C1HR80WB01D; RoHS: Yes; Category: Ceramic Capacitors; Stock 1: 5080000; Pricing 1: 10000=0.04420, 20000=0.03850 (USD); Mount: Surface Mount; Case/Package: 0402; Case Code (Metric): 1005; Case Code (Imperial): 0402; Min Operating Temperature: -55°C; Max Operating Temperature: 125°C; Package Quantity: 10000; Capacitance: 0.8pF; Voltage Rating: 50V; Packaging: Tape and Reel; Voltage Rating (DC): 50V; Termination: SMD/SMT; Series: GJM; Construction: Flat; Length: 1mm; Width: 0.02inch; Height: 0.5mm; Thickness: 0.022inch; Depth: 0.5mm; Radiation Hardening: No; RoHS Compliant: Yes; ComponentLink1URL: https://datasheet.ciiva.com/170/product-170100.pdf?src-supplier=Digi-Key; ComponentLink1Description: https://datasheet.ciiva.com/170/product-170100.pdf?src-supplier=Digi-Key; ComponentLink2URL: https://datasheet.ciiva.com/11616/product-11616842.pdf?src-supplier=Avnet; ComponentLink2Description: https://datasheet.ciiva.com/11616/product-11616842.pdf?src-supplier=Avnet; Supplier Part Number 1: GJM1555C1HR80WB01D
J1 = U.FL-R-SMT-1(80): CONN U.FL RCPT STR 50 OHM SMD; Manufacturer: Hirose; Supplier 1: Future Electronics; Manufacturer Part Number: U.FL-R-SMT-1(80); Stock 1: 1272; Pricing 1: 1=1.07, 500=0.785, 1500=0.74, 2500=0.72, 5000=0.695 (USD); Case/Package: SMD/SMT; Package Quantity: 10000; Packaging: Tape and Reel; Lead Free: Lead Free; ComponentLink1URL: https://www.hirose.com/product/en/download_file/key_name/U.FL-R-SMT-1%2880%29/category/Specification%20Sheet/doc_file_id/37638/?file_category_id=9&item_id=03310472280&is_series=&src-supplier=Digi-Key; ComponentLink1Description: https://www.hirose.com/product/en/download_file/key_name/U.FL-R-SMT-1%2880%29/category/Specification%20Sheet/doc_file_id/37638/?file_category_id=9&item_id=03310472280&is_series=&src-supplier=Digi-Key; ComponentLink2URL: http://www.mouser.com/ds/2/185/U.FL_catalog-939761.pdf?src-supplier=Mouser; ComponentLink2Description: http://www.mouser.com/ds/2/185/U.FL_catalog-939761.pdf?src-supplier=Mouser; Supplier Part Number 1: U.FL-R-SMT-1(80)-CUTT
L3 = MGFL2012F100MT-LF: 500mA 10uH ±20% 320mΩ 0805 Inductors (SMD) ROHS; Manufacturer: microgate; Manufacturer Part Number: MGFL2012F100MT-LF; Footprint: IND 0805; Value: 10uH
L4 = CS0402-15NH-S: 560mA 15nH ±3% 170mΩ 0402 Inductors (SMD) ROHS; Manufacturer: Chilisin Elec; Manufacturer Part Number: CS0402-15NH-S; Package: 0402; LCSC Part Number: C329619; Item Type: Inductor; ComponentLink1Description: LCSC; ComponentLink1URL: https://www.lcsc.com/product-detail/Inductors-SMD_Chilisin-Elec-CS0402-15NH-S_C329619.html
L5 = LQW18AN3N9C10D: Inductor RF Chip Wirewound 3.9nH 0.2nH 100MHz 38Q-Factor 1A 32mOhm DCR 0603 Paper T/R; Manufacturer: Murata; Core Material: Non-Magnetic; Shielding: Unshielded; Self Resonant Frequency: 11GHz; DC Resistance (DCR): 32mR; Q Factor: 38; Supplier 1: RSComponents; Manufacturer Part Number: LQW18AN3N9C10D; RoHS: Yes; Category: Fixed Inductors; Stock 1: 1; Pricing 1: 10=0.16800 (USD); Mount: Surface Mount; Case/Package: 0603; Weight: 0.000106oz; Case Code (Metric): 1608; Case Code (Imperial): 0603; Min Operating Temperature: -55°C; Max Operating Temperature: 125°C; Packaging: Tape and Reel; Inductance: 3.9nH; Package Quantity: 4000; Current Rating: 1A; Resistor Type: Wirewound; Test Frequency: 100MHz; Max DC Current: 1A; Termination: SMD/SMT; DC Current: 1A; Series: LQW18A_10; Length: 1.6mm; Width: 0.031inch; Height: 0.8mm; Height - Seated (Max): 0.039inch; Depth: 1.1mm; Radiation Hardening: No; REACH SVHC: No SVHC; Military Standard: Not; RoHS Compliant: Yes; ComponentLink1URL: https://datasheet.ciiva.com/11799/0900766b80a002db-11799288.pdf?src-supplier=RSComponents; ComponentLink1Description: https://datasheet.ciiva.com/11799/0900766b80a002db-11799288.pdf?src-supplier=RSComponents; ComponentLink2URL: https://datasheet.ciiva.com/6705/l0075s0080lqw18a-10-6705579.pdf?src-supplier=Digi-Key; ComponentLink2Description: https://datasheet.ciiva.com/6705/l0075s0080lqw18a-10-6705579.pdf?src-supplier=Digi-Key; ComponentLink3URL: https://datasheet.ciiva.com/6705/l0075s0080lqw18a-10-6705577.pdf?src-supplier=Digi-Key; ComponentLink3Description: https://datasheet.ciiva.com/6705/l0075s0080lqw18a-10-6705577.pdf?src-supplier=Digi-Key; ComponentLink4URL: https://datasheet.ciiva.com/6705/l0075s0080lqw18a-10-6705578.pdf?src-supplier=Digi-Key; ComponentLink4Description: https://datasheet.ciiva.com/6705/l0075s0080lqw18a-10-6705578.pdf?src-supplier=Digi-Key; ComponentLink5URL: https://datasheet.ciiva.com/4976/product-4976636.pdf?src-supplier=Mouser; ComponentLink5Description: https://datasheet.ciiva.com/4976/product-4976636.pdf?src-supplier=Mouser; Supplier Part Number 1: 7242951
SB3 = Solder Bridge: Solder Bridge ON
U6 = NRF52810-QCAA-R: IC RF TXRX+MCU BLUETOOTH 32WFQFN; Manufacturer: Nordic Semiconductor; Supplier 1: Digi-Key; Manufacturer Part Number: NRF52810-QCAA-R; RoHS: Yes; Category: RF Receivers, Transceivers; Stock 1: 2906; Pricing 1: 1=3.54000, 10=3.16200, 25=2.84640, 100=2.59320, 250=2.34024, 500=2.09990, 1000=1.77100 (USD); RoHS Compliant: Yes; Supplier Part Number 1: 1490-NRF52810-QCAA-RCT-ND
X3 = XC32M4-32.000-F12NLDT: 32MHz SMD Crystal Resonator 12pF 40Ω ±10ppm ±20ppm -40℃~+85℃ SMD3225-4P Crystals ROHS; Manufacturer: HCI; Manufacturer Part Number: XC32M4-32.000-F12NLDT; Footprint: Custom
X4 = X321532768KGD2SI: as X1 on sheet Controller-Section; Manufacturer Part Number: X321532768KGD2SI; Footprint: Custom; ComponentLink1Description: LCSC; ComponentLink1URL: https://www.lcsc.com/product-detail/Crystals_Yangxing-Tech-X321532768KGD2SI_C620155.html

## Sheet Connector-Section.SchDoc
size A4; SheetNumber: 8; SheetTotal: 8
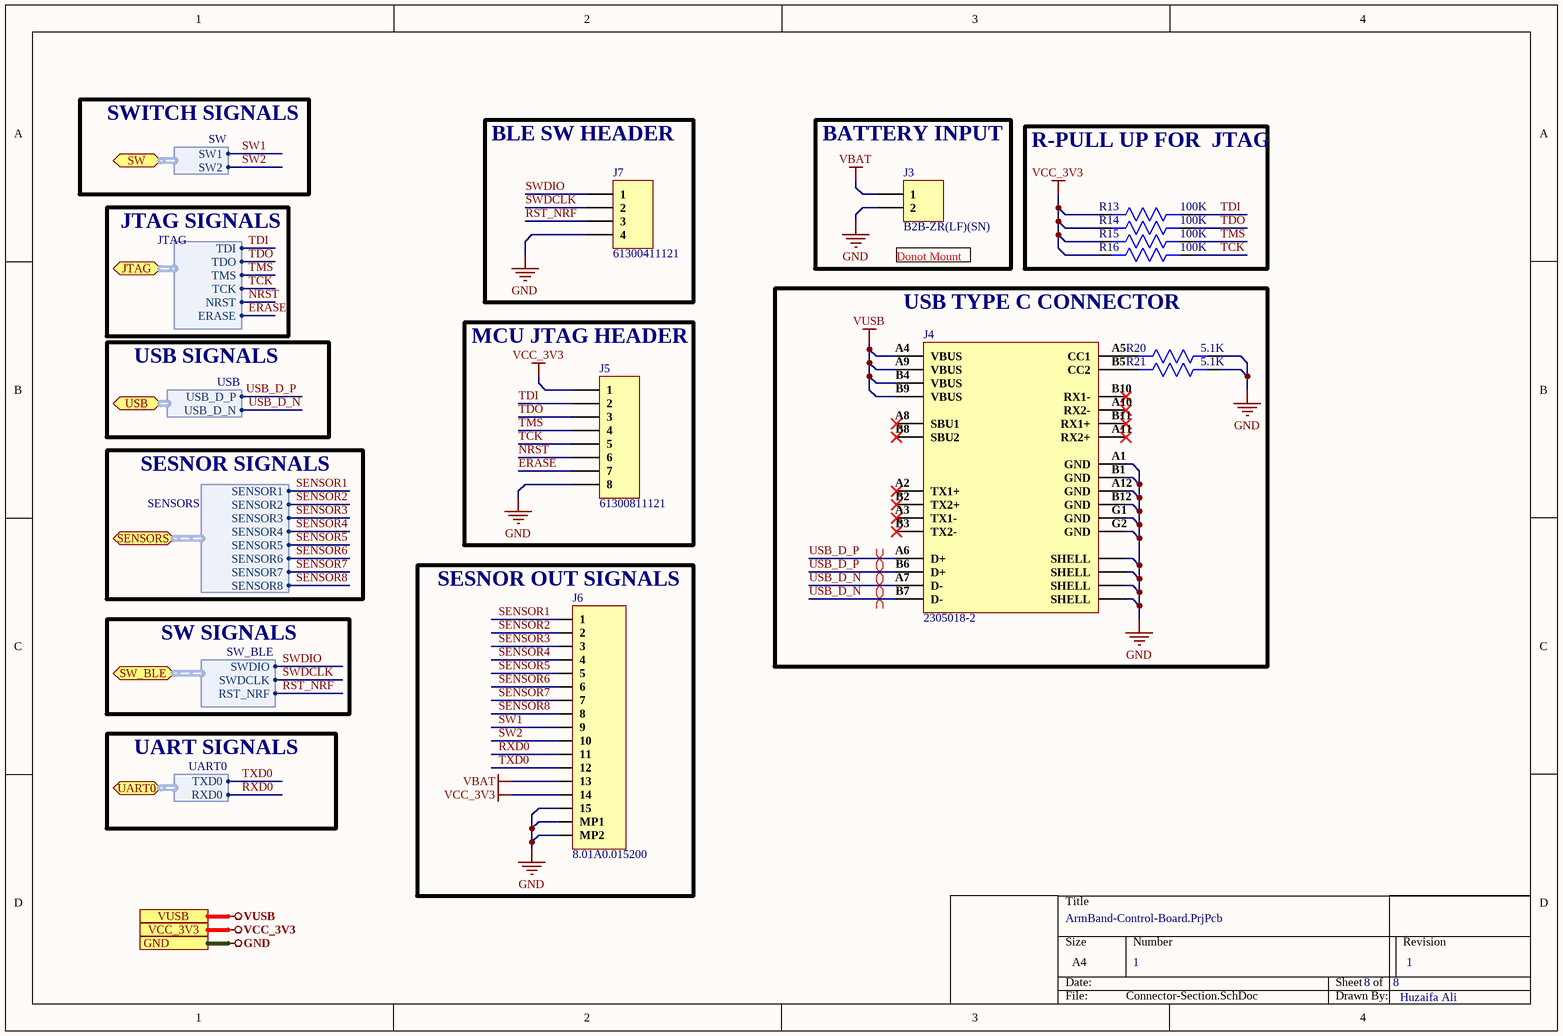
[diagram p7: Connector-Section.SchDoc]

### Parts
J3  B2B-ZR(LF)(SN)  [B2B-ZR(LF)(SN)]
J4  2305018-2  [2305018-2]
J5  61300811121  [HDR1X8]
J6  8.01A0.015200  [8.01A0.015200]
J7  61300411121  [HDR1X4]
R13  100K  [Res0402]
R14  100K  [Res0402]
R15  100K  [Res0402]
R16  100K  [Res0402]
R20  5.1K  [Res0603]
R21  5.1K  [Res0603]

### Blocks framed on the sheet
BLE SW HEADER: J7
BATTERY INPUT: J3
R-PULL UP FOR  JTAG: R13-R16
USB TYPE C CONNECTOR: J4 R20 R21
MCU JTAG HEADER: J5
SESNOR OUT SIGNALS: J6

### Ports
GND, JTAG (bidir, harness JTAG), SENSORS (bidir, harness SENSORS), SW (bidir, harness SW), SW_BLE (bidir, harness SW_BLE), UART0 (bidir, harness UART0), USB (bidir, harness USB), VCC_3V3, VUSB

### Harnesses
SENSORS: SENSOR1, SENSOR2, SENSOR3, SENSOR4, SENSOR5, SENSOR6, SENSOR7, SENSOR8
SW: SW1, SW2
JTAG: TDI, TDO, TMS, TCK, NRST, ERASE
SW_BLE: SWDIO, SWDCLK, RST_NRF
UART0: TXD0, RXD0
USB: USB_D_P, USB_D_N

### Nets
GND: J3.2 J4.A1(GND) J4.A12(GND) J4.B1(GND) J4.B12(GND) J4.G1(GND) J4.G2(GND) J4.S1(SHELL) J4.S2(SHELL) J4.S3(SHELL) J4.S4(SHELL) J5.8 J6.15 J6.MP1 J6.MP2 J7.4 R20.1 R21.1 ; port GND
VBAT: J3.1 J6.13
VCC_3V3: J5.1 J6.14 R13.2 R14.2 R15.2 R16.2 ; port VCC_3V3
VUSB: J4.A4(VBUS) J4.A9(VBUS) J4.B4(VBUS) J4.B9(VBUS) ; port VUSB
ERASE: J5.7 ; port JTAG.ERASE
NRST: J5.6 ; port JTAG.NRST
RST_NRF: J7.3 ; port SW_BLE.RST_NRF
RXD0: J6.11 ; port UART0.RXD0
SENSOR1: J6.1 ; port SENSORS.SENSOR1
SENSOR2: J6.2 ; port SENSORS.SENSOR2
SENSOR3: J6.3 ; port SENSORS.SENSOR3
SENSOR4: J6.4 ; port SENSORS.SENSOR4
SENSOR5: J6.5 ; port SENSORS.SENSOR5
SENSOR6: J6.6 ; port SENSORS.SENSOR6
SENSOR7: J6.7 ; port SENSORS.SENSOR7
SENSOR8: J6.8 ; port SENSORS.SENSOR8
SW1: J6.9 ; port SW.SW1
SW2: J6.10 ; port SW.SW2
SWDCLK: J7.2 ; port SW_BLE.SWDCLK
SWDIO: J7.1 ; port SW_BLE.SWDIO
TCK: J5.5 R16.1 ; port JTAG.TCK
TDI: J5.2 R13.1 ; port JTAG.TDI
TDO: J5.3 R14.1 ; port JTAG.TDO
TMS: J5.4 R15.1 ; port JTAG.TMS
TXD0: J6.12 ; port UART0.TXD0
USB_D_N: J4.A7(D-) J4.B7(D-) ; port USB.USB_D_N
USB_D_P: J4.A6(D+) J4.B6(D+) ; port USB.USB_D_P
NetJ4_A5: J4.A5(CC1) R20.2
NetJ4_B5: J4.B5(CC2) R21.2

Not connected (* = marked no-connect by the designer): J4 A2(TX1+)* A3(TX1-)* A8(SBU1)* A10(RX2-)* A11(RX2+)* B2(TX2+)* B3(TX2-)* B8(SBU2)* B10(RX1-)* B11(RX1+)*

### Layout directives
differential pair; net class USB; differential pair class USB_Lines; rule Impedance Constraint [Min = 85.00    Max = 90.00    ]; rule Matched Net Lengths [Tolerance = 50mil]: USB_D_N, USB_D_P

### Notes on the sheet
- SWITCH SIGNALS
- JTAG SIGNALS
- (near J3) Donot Mount
- USB SIGNALS
- SESNOR SIGNALS
- SW SIGNALS
- UART SIGNALS
- 1
- Huzaifa Ali

### Library data of the parts
J3 = B2B-ZR(LF)(SN): CONN HEADER VERT 2POS 1.5MM; Manufacturer: JST; Body Plating: Tin; Number of Positions: 2; Contact Resistance: 30mR; Max Current Rating: 1A; Max Voltage Rating (AC): 50V; Gender: Male; Insulation Resistance: 500MR; Panel Thickness: 3.5mm; Supplier 1: Digi-Key; Manufacturer Part Number: B2B-ZR(LF)(SN); RoHS: Yes; Category: Board to Board Connectors; Stock 1: 113095; Pricing 1: 1=0.17000, 10=0.13500, 100=0.09990, 500=0.08270, 1000=0.07237, 5000=0.06203, 10000=0.06031 (USD); Mount: Through Hole; Contact Plating: Copper,Tin; Color: White; Contact Material: Brass,Copper,Tin; Housing Color: Beige; Housing Material: Polyamide; Material: Nylon; Contact Shape: Circular; Insulation Material: Nylon; Insulation Color: Natural; Contact Finish - Mating: TIN; Min Operating Temperature: -25°C; Max Operating Temperature: 85°C; Number of Rows: 1; Packaging: Bulk; Connector Type: Header; Termination: Solder; Current Rating: 1A; Orientation: Straight; Fastening Type: Detent; Number of Contacts: 2; Series: ZH; Contact Type: Male Pin; Voltage Rating: 50V; Voltage Rating (AC): 50V; Voltage Rating (DC): 50V; Length: 4.5mm; Pitch: 1.5mm; Depth: 3.5mm; Lead Pitch: 1.5mm; Contact Mating Length: 0.094inch; Lead Free: Lead Free; REACH SVHC: No SVHC; Flammability Rating: UL94 V-0; ComponentLink1URL: https://datasheet.ciiva.com/11752/0900766b8082f580-11752167.pdf?src-supplier=RSComponents; ComponentLink1Description: https://datasheet.ciiva.com/11752/0900766b8082f580-11752167.pdf?src-supplier=RSComponents; ComponentLink2URL: https://datasheet.ciiva.com/25616/0900766b81147f94-25616906.pdf?src-supplier=RSComponents; ComponentLink2Description: https://datasheet.ciiva.com/25616/0900766b81147f94-25616906.pdf?src-supplier=RSComponents; ComponentLink3URL: https://datasheet.ciiva.com/26894/getdatasheetpartid-643133-26894438.pdf?src-supplier=Verical; ComponentLink3Description: https://datasheet.ciiva.com/26894/getdatasheetpartid-643133-26894438.pdf?src-supplier=Verical; ComponentLink4URL: https://datasheet.ciiva.com/712/ezh-712443.pdf?src-supplier=Digi-Key; ComponentLink4Description: https://datasheet.ciiva.com/712/ezh-712443.pdf?src-supplier=Digi-Key; ComponentLink5URL: https://datasheet.ciiva.com/8052/80551-8052026.pdf?src-supplier=Element14; ComponentLink5Description: https://datasheet.ciiva.com/8052/80551-8052026.pdf?src-supplier=Element14; Supplier Part Number 1: 455-1657-ND
J4 = 2305018-2: CONN RCP USB3.1 TYPEC 24P SMD RA; Manufacturer: TE Connectivity AMP; Connector Type: USB; Number of Contacts: 24; Gender: Receptacle; Number of Ports: 1; Current Rating: 1.25A; Voltage Rating: 30V; Shielding: Shielded; Ratings: Waterproof; Supplier 1: Digi-Key; Manufacturer Part Number: 2305018-2; RoHS: Yes; Category: USB Connectors; Stock 1: 4590; Pricing 1: 1=3.00000, 10=2.87800, 25=2.63840, 50=2.51840, 100=2.39840, 250=2.09864 (USD); Mount: Surface Mount,Through Hole; Contact Plating: Gold; Insulation Color: Black; Min Operating Temperature: -40°C; Max Operating Temperature: 85°C; Packaging: Tape and Reel; Termination: Solder; Flammability Rating: UL94 V-0; RoHS Compliant: Yes; ComponentLink1URL: http://www.farnell.com/datasheets/2611889.pdf?src-supplier=Farnell; ComponentLink1Description: http://www.farnell.com/datasheets/2611889.pdf?src-supplier=Farnell; ComponentLink2URL: https://www.te.com/commerce/DocumentDelivery/DDEController?Action=srchrtrv&DocNm=2305018&DocType=Customer+Drawing&DocLang=English&src-supplier=Digi-Key; ComponentLink2Description: https://www.te.com/commerce/DocumentDelivery/DDEController?Action=srchrtrv&DocNm=2305018&DocType=Customer+Drawing&DocLang=English&src-supplier=Digi-Key; ComponentLink3URL: http://www.farnell.com/datasheets/2611889.pdf?src-supplier=Newark; ComponentLink3Description: http://www.farnell.com/datasheets/2611889.pdf?src-supplier=Newark; Supplier Part Number 1: A132569CT-ND
J5 = 61300811121: CONN HEADER VERT 8POS 2.54MM; Manufacturer: Wurth Electronics; Number of Positions: 8; Gender: Male; Connector Type: Male Pin; Pitch: 0.1inch; Supplier 1: Digi-Key; Manufacturer Part Number: 61300811121; Stock 1: 7405; Pricing 1: 1=0.37, 10=0.315, 25=0.2632, 50=0.219, 100=0.199, 1000=0.181 (USD); Mount: Through Hole; Contact Plating: Gold; Contact Material: Copper; Color: Black; Number of Rows: 1; Packaging: Bulk; Termination: Solder; Number of Contacts: 8; Contact Mating Length: 0.236inch; REACH SVHC: Unknown; ComponentLink1URL: http://www.farnell.com/cad/1737268.pdf?src-supplier=Element14; ComponentLink1Description: http://www.farnell.com/cad/1737268.pdf?src-supplier=Element14; ComponentLink2URL: https://katalog.we-online.de/em/datasheet/6130xx11121.pdf?src-supplier=Digi-Key; ComponentLink2Description: https://katalog.we-online.de/em/datasheet/6130xx11121.pdf?src-supplier=Digi-Key; Supplier Part Number 1: 732-5321-ND
J6 = 8.01A0.015200: -40℃~+80℃ 15P Dual-sided contacts / top and bottom connection 0.5mm SMD,P=0.5mm,Surface Mount，Right Angle FFC, FPC (Flat Flexible) Connector Assemblies ROHS; Manufacturer: DIANWEI; Item Type: FFC, FPC Connector; Manufacturer Part Number: 8.01A0.015200; Package: SMD,P=0.5mm,Surface Mount，Right Angle; LCSC Part Number: C19188796; ComponentLink1Description: LCSC; ComponentLink1URL: https://www.lcsc.com/product-detail/FFC-FPC-Flat-Flexible-Connector-Assemblies_DIANWEI-8-01A0-015200_C19188796.html?s_z=n_HC-FPC-05-20-15RLTAG
J7 = 61300411121: CONN HEADER VERT 4POS 2.54MM; Manufacturer: Wurth Electronics; Number of Positions: 4; Gender: Male; Connector Type: Male Pin; Pitch: 0.1inch; Supplier 1: Digi-Key; Manufacturer Part Number: 61300411121; Stock 1: 20544; Pricing 1: 1=0.18, 10=0.153, 25=0.1272, 50=0.106, 100=0.096, 1000=0.088 (USD); Mount: Through Hole; Contact Plating: Gold; Contact Material: Copper; Color: Black; Number of Rows: 1; Packaging: Bulk; Termination: Solder; Number of Contacts: 4; Contact Mating Length: 0.236inch; REACH SVHC: Unknown; Lead Free: Lead Free; ComponentLink1URL: http://www.farnell.com/cad/1737268.pdf?src-supplier=Element14; ComponentLink1Description: http://www.farnell.com/cad/1737268.pdf?src-supplier=Element14; ComponentLink2URL: https://katalog.we-online.de/em/datasheet/6130xx11121.pdf?src-supplier=Digi-Key; ComponentLink2Description: https://katalog.we-online.de/em/datasheet/6130xx11121.pdf?src-supplier=Digi-Key; Supplier Part Number 1: 732-5317-ND
R13-R16 = ERJPA2F1003X: as R7 on sheet Controller-Section; Supplier 1: Digi-Key; Stock 1: 8829; Pricing 1: 1=0.21, 10=0.175, 100=0.0686, 1000=0.02871, 2500=0.02632, 5000=0.02393 (USD); Case/Package: 0402; Case Code (Metric): 1005; Case Code (Imperial): 0402; Min Operating Temperature: -55°C; Max Operating Temperature: 155°C; Packaging: Cut Tape; Composition: Thick Film; Number of Terminations: 2; Tolerance: 1%; Max Power Dissipation: 200mW; Voltage Rating (DC): 50V; Features: Automotive AEC-Q200; Length: 0.039inch; Height: 0.016inch; Width: 0.02inch; REACH SVHC: Unknown; ComponentLink1URL: http://www.farnell.com/datasheets/2051174.pdf?src-supplier=Element14; ComponentLink1Description: http://www.farnell.com/datasheets/2051174.pdf?src-supplier=Element14; ComponentLink2URL: https://industrial.panasonic.com/ww/system/files/data/download/catalog/id_fixed-resistors_e_1.pdf?src-supplier=Digi-Key; ComponentLink2Description: https://industrial.panasonic.com/ww/system/files/data/download/catalog/id_fixed-resistors_e_1.pdf?src-supplier=Digi-Key; Supplier Part Number 1: P17236CT-ND
R20 R21 = RMCF0603FT5K10: RES 5.1K OHM 1% 1/10W 0603; Manufacturer: Stackpole Electronics; Resistance: 5.1kR; Max Power Dissipation: 100mW; Temperature Coefficient: 100ppm/°C; Supplier 1: Digi-Key; Manufacturer Part Number: RMCF0603FT5K10; Stock 1: 58341; Pricing 1: 1=0.1, 10=0.017, 100=0.0068, 1000=0.00305, 2500=0.00264 (USD); Mount: Surface Mount; Case/Package: 0603; Case Code (Metric): 1608; Case Code (Imperial): 0603; Contact Plating: Tin,Matte; Min Operating Temperature: -55°C; Max Operating Temperature: 155°C; Tolerance: 1%; Packaging: Tape and Reel; Resistor Type: Thick Film; Number of Terminations: 2; Features: Automotive AEC-Q200; Series: RMCF; Length: 0.061inch; Width: 0.031inch; Height: 0.022inch; Radiation Hardening: No; RoHS Compliant: Yes; ComponentLink1URL: https://www.seielect.com/catalog/SEI-RMCF_RMCP.pdf?src-supplier=Avnet; ComponentLink1Description: https://www.seielect.com/catalog/SEI-RMCF_RMCP.pdf?src-supplier=Avnet; ComponentLink2URL: http://components.arrow.com/part/dataview/50863347S9465827N1174?src-supplier=Arrow+Electronics; ComponentLink2Description: http://components.arrow.com/part/dataview/50863347S9465827N1174?src-supplier=Arrow+Electronics; ComponentLink3URL: https://www.seielect.com/catalog/SEI-Packaging.pdf?src-supplier=Digi-Key; ComponentLink3Description: https://www.seielect.com/catalog/SEI-Packaging.pdf?src-supplier=Digi-Key; Supplier Part Number 1: RMCF0603FT5K10DKR-ND